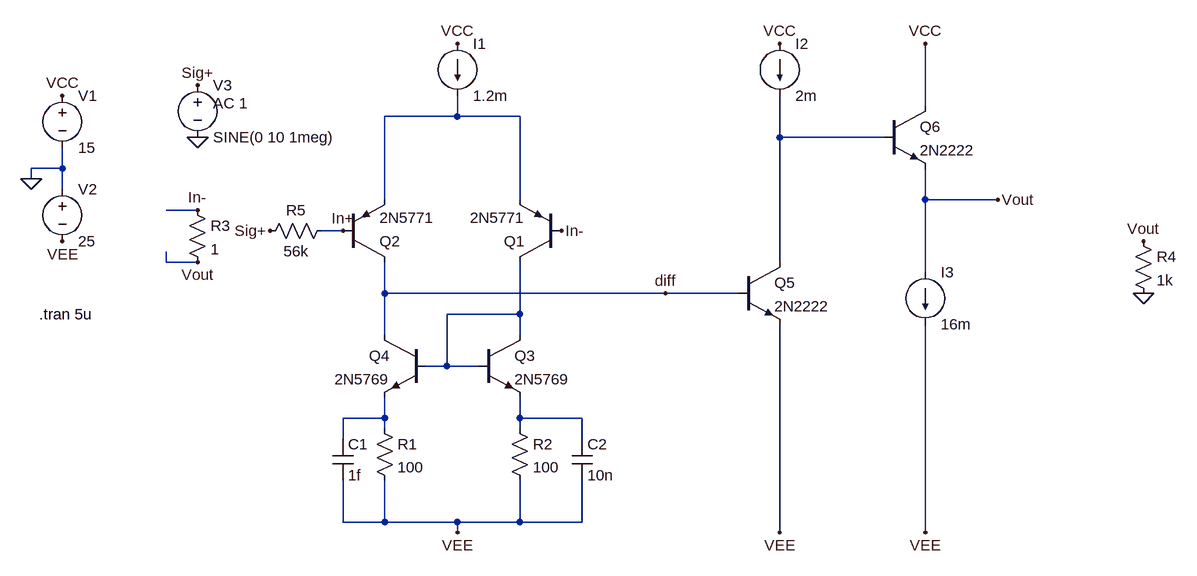
[diagram p0: schematic differential_amplifier.asc]
differential_amplifier.asc, the LTspice schematic file:
Version 4
SHEET 1 1208 688
WIRE 800 -80 800 -176
WIRE 80 -64 80 -96
WIRE 80 -64 -32 -64
WIRE 176 -64 80 -64
WIRE 576 -32 576 -96
WIRE 736 -32 576 -32
WIRE -528 16 -528 -16
WIRE -528 16 -576 16
WIRE -576 32 -576 16
WIRE -528 48 -528 16
WIRE -32 64 -32 -64
WIRE 176 64 176 -64
WIRE 800 64 800 16
WIRE 912 64 800 64
WIRE -320 80 -368 80
WIRE -96 112 -128 112
WIRE -368 160 -368 144
WIRE -320 160 -368 160
WIRE 576 160 576 -32
WIRE 800 176 800 64
WIRE -32 208 -32 160
WIRE 400 208 -32 208
WIRE 512 208 400 208
WIRE 176 240 176 160
WIRE 176 240 64 240
WIRE -32 272 -32 208
WIRE 176 272 176 240
WIRE 64 320 64 240
WIRE 64 320 32 320
WIRE 112 320 64 320
WIRE -32 400 -32 368
WIRE -32 400 -96 400
WIRE 176 400 176 368
WIRE 272 400 176 400
WIRE -32 416 -32 400
WIRE 176 416 176 400
WIRE -96 432 -96 400
WIRE 272 432 272 400
WIRE -96 560 -96 496
WIRE -32 560 -32 496
WIRE -32 560 -96 560
WIRE 80 560 -32 560
WIRE 176 560 176 496
WIRE 176 560 80 560
WIRE 272 560 272 496
WIRE 272 560 176 560
WIRE 80 576 80 560
WIRE 576 576 576 256
WIRE 800 576 800 256
FLAG -576 32 0
FLAG -528 -96 VCC
FLAG -528 128 VEE
FLAG 80 -176 VCC
FLAG 80 576 VEE
FLAG 240 112 In-
FLAG -208 112 Sig+
FLAG 576 -176 VCC
FLAG 800 -176 VCC
FLAG 576 576 VEE
FLAG 800 576 VEE
FLAG 912 64 Vout
FLAG 400 208 diff
FLAG -320 -112 Sig+
FLAG -320 80 In-
FLAG -320 -32 0
FLAG -320 160 Vout
FLAG 1136 128 Vout
FLAG 1136 208 0
FLAG -96 112 In+
SYMBOL pnp 240 160 R180
SYMATTR InstName Q1
SYMATTR Value 2N5771
SYMBOL pnp -96 160 M180
SYMATTR InstName Q2
SYMATTR Value 2N5771
SYMBOL npn 112 272 R0
SYMATTR InstName Q3
SYMATTR Value 2N5769
SYMBOL npn 32 272 M0
SYMATTR InstName Q4
SYMATTR Value 2N5769
SYMBOL res -48 400 R0
SYMATTR InstName R1
SYMATTR Value 100
SYMBOL res 160 400 R0
SYMATTR InstName R2
SYMATTR Value 100
SYMBOL current 80 -176 R0
WINDOW 123 0 0 Left 0
WINDOW 39 0 0 Left 0
SYMATTR InstName I1
SYMATTR Value 1.2m
SYMBOL voltage -528 -112 R0
WINDOW 123 0 0 Left 0
WINDOW 39 0 0 Left 0
SYMATTR InstName V1
SYMATTR Value 15
SYMBOL voltage -528 32 R0
WINDOW 123 0 0 Left 0
WINDOW 39 0 0 Left 0
SYMATTR InstName V2
SYMATTR Value 25
SYMBOL npn 512 160 R0
SYMATTR InstName Q5
SYMATTR Value 2N2222
SYMBOL npn 736 -80 R0
SYMATTR InstName Q6
SYMATTR Value 2N2222
SYMBOL current 576 -176 R0
WINDOW 123 0 0 Left 0
WINDOW 39 0 0 Left 0
SYMATTR InstName I2
SYMATTR Value 2m
SYMBOL current 800 176 R0
WINDOW 123 0 0 Left 0
WINDOW 39 0 0 Left 0
SYMATTR InstName I3
SYMATTR Value 16m
SYMBOL voltage -320 -128 R0
WINDOW 123 24 44 Left 2
WINDOW 39 0 0 Left 0
SYMATTR InstName V3
SYMATTR Value SINE(0 10 1meg)
SYMATTR Value2 AC 1
SYMBOL res -336 64 R0
SYMATTR InstName R3
SYMATTR Value 1
SYMBOL res 1120 112 R0
SYMATTR InstName R4
SYMATTR Value 1k
SYMBOL res -112 96 R90
WINDOW 0 0 56 VBottom 2
WINDOW 3 32 56 VTop 2
SYMATTR InstName R5
SYMATTR Value 56k
SYMBOL cap -112 432 R0
SYMATTR InstName C1
SYMATTR Value 1f
SYMBOL cap 256 432 R0
SYMATTR InstName C2
SYMATTR Value 10n
TEXT -564 240 Left 2 !.tran 5u

The netlist it stands for:
* differential_amplifier.asc
Q1 N003 In- N001 0 2N5771
Q2 diff In+ N001 0 2N5771
Q3 N003 N003 N005 0 2N5769
Q4 diff N003 N004 0 2N5769
R1 N004 VEE 100
R2 N005 VEE 100
I1 VCC N001 1.2m
V1 VCC 0 15
V2 0 VEE 25
Q5 N002 diff VEE 0 2N2222
Q6 VCC N002 Vout 0 2N2222
I2 VCC N002 2m
I3 Vout VEE 16m
V3 Sig+ 0 SINE(0 10 1meg) AC 1
R3 In- Vout 1
R4 Vout 0 1k
R5 In+ Sig+ 56k
C1 N004 VEE 1f
C2 N005 VEE 10n
.model NPN NPN
.model PNP PNP
.lib standard.bjt
.tran 5u
.backanno
.end